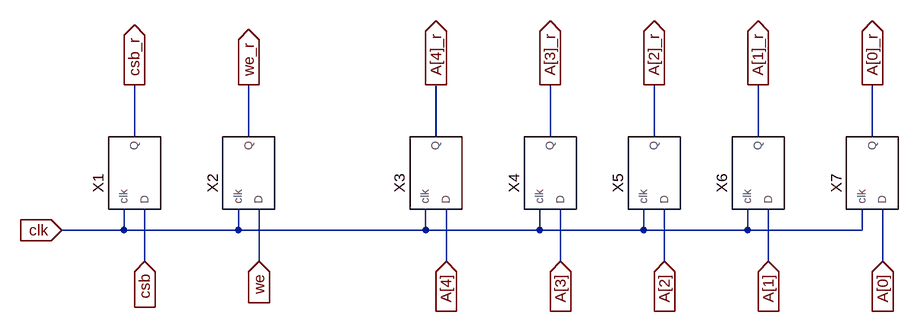
[diagram p0: schematic control_dffs.asc]
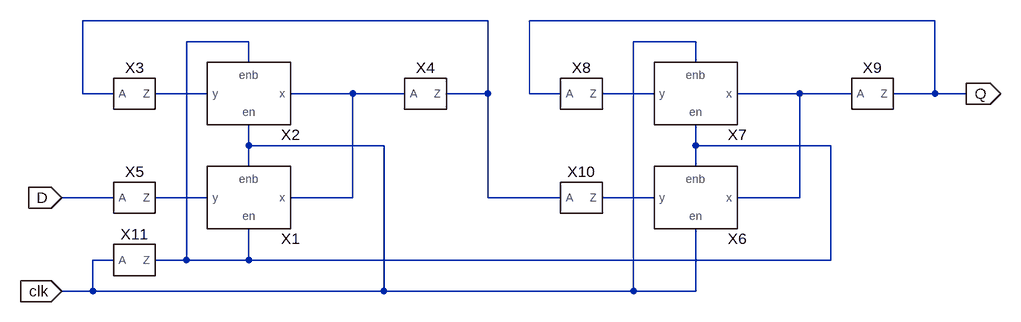
[diagram p1: sub-circuit dff.asc]
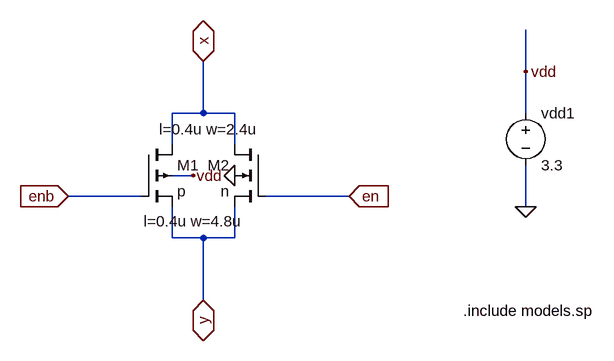
[diagram p2: sub-circuit tri_gate.asc]
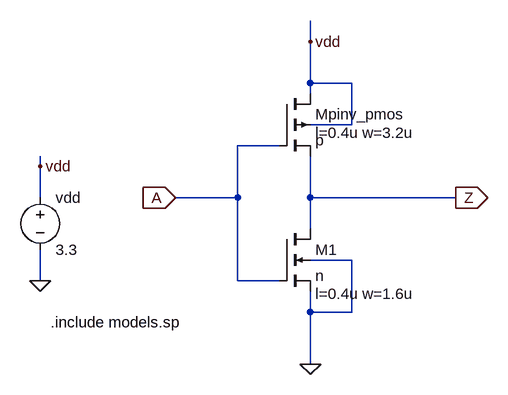
[diagram p3: sub-circuit inv.asc]
control_dffs.asc, the LTspice schematic file:
Version 4
SHEET 1 1192 680
WIRE -32 64 -32 -16
WIRE 144 64 144 -16
WIRE 432 64 432 -16
WIRE 608 64 608 -16
WIRE 768 64 768 -16
WIRE 928 64 928 -16
WIRE 1104 64 1104 -16
WIRE -48 208 -48 176
WIRE -48 208 -144 208
WIRE 128 208 128 176
WIRE 128 208 -48 208
WIRE 416 208 416 176
WIRE 416 208 128 208
WIRE 592 208 592 176
WIRE 592 208 416 208
WIRE 752 208 752 176
WIRE 752 208 592 208
WIRE 912 208 912 176
WIRE 912 208 752 208
WIRE 1088 208 1088 176
WIRE 1088 208 912 208
WIRE -16 256 -16 176
WIRE 160 256 160 176
WIRE 448 256 448 176
WIRE 624 256 624 176
WIRE 784 256 784 176
WIRE 944 256 944 176
WIRE 1120 256 1120 176
FLAG 448 256 A[4]
IOPIN 448 256 In
FLAG 624 256 A[3]
IOPIN 624 256 In
FLAG 784 256 A[2]
IOPIN 784 256 In
FLAG 944 256 A[1]
IOPIN 944 256 In
FLAG 1120 256 A[0]
IOPIN 1120 256 In
FLAG -16 256 csb
IOPIN -16 256 In
FLAG 160 256 we
IOPIN 160 256 In
FLAG -144 208 clk
IOPIN -144 208 In
FLAG -32 -16 csb_r
IOPIN -32 -16 Out
FLAG 144 -16 we_r
IOPIN 144 -16 Out
FLAG 432 -16 A[4]_r
IOPIN 432 -16 Out
FLAG 608 -16 A[3]_r
IOPIN 608 -16 Out
FLAG 768 -16 A[2]_r
IOPIN 768 -16 Out
FLAG 928 -16 A[1]_r
IOPIN 928 -16 Out
FLAG 1104 -16 A[0]_r
IOPIN 1104 -16 Out
SYMBOL dff -16 144 R270
SYMATTR InstName X1
SYMBOL dff 160 144 R270
SYMATTR InstName X2
SYMBOL dff 448 144 R270
SYMATTR InstName X3
SYMBOL dff 624 144 R270
SYMATTR InstName X4
SYMBOL dff 784 144 R270
SYMATTR InstName X5
SYMBOL dff 944 144 R270
SYMATTR InstName X6
SYMBOL dff 1120 144 R270
SYMATTR InstName X7

dff.asc, the sub-circuit schematic file:
Version 4
SHEET 1 1748 1736
WIRE 16 -160 -608 -160
WIRE 704 -160 80 -160
WIRE -352 -128 -448 -128
WIRE 336 -128 240 -128
WIRE -352 -96 -352 -128
WIRE 336 -96 336 -128
WIRE -608 -48 -608 -160
WIRE -560 -48 -608 -48
WIRE -416 -48 -496 -48
WIRE -192 -48 -288 -48
WIRE -112 -48 -192 -48
WIRE 16 -48 16 -160
WIRE 16 -48 -48 -48
WIRE 80 -48 80 -160
WIRE 128 -48 80 -48
WIRE 272 -48 192 -48
WIRE 496 -48 400 -48
WIRE 576 -48 496 -48
WIRE 704 -48 704 -160
WIRE 704 -48 640 -48
WIRE 752 -48 704 -48
WIRE -352 32 -352 0
WIRE -144 32 -352 32
WIRE 336 32 336 0
WIRE 544 32 336 32
WIRE -352 64 -352 32
WIRE 336 64 336 32
WIRE -560 112 -640 112
WIRE -416 112 -496 112
WIRE -192 112 -192 -48
WIRE -192 112 -288 112
WIRE 16 112 16 -48
WIRE 128 112 16 112
WIRE 272 112 192 112
WIRE 496 112 496 -48
WIRE 496 112 400 112
WIRE -560 208 -592 208
WIRE -448 208 -448 -128
WIRE -448 208 -496 208
WIRE -352 208 -352 160
WIRE -352 208 -448 208
WIRE 544 208 544 32
WIRE 544 208 -352 208
WIRE -592 256 -592 208
WIRE -592 256 -640 256
WIRE -144 256 -144 32
WIRE -144 256 -592 256
WIRE 240 256 240 -128
WIRE 240 256 -144 256
WIRE 336 256 336 160
WIRE 336 256 240 256
FLAG -640 256 clk
IOPIN -640 256 In
FLAG -640 112 D
IOPIN -640 112 In
FLAG 752 -48 Q
IOPIN 752 -48 Out
SYMBOL tri_gate -352 112 R180
SYMATTR InstName X1
SYMBOL tri_gate -352 -48 R180
SYMATTR InstName X2
SYMBOL inv -528 -48 R0
SYMATTR InstName X3
SYMBOL inv -80 -48 R0
SYMATTR InstName X4
SYMBOL inv -528 112 R0
SYMATTR InstName X5
SYMBOL tri_gate 336 112 R180
SYMATTR InstName X6
SYMBOL tri_gate 336 -48 R180
SYMATTR InstName X7
SYMBOL inv 160 -48 R0
SYMATTR InstName X8
SYMBOL inv 608 -48 R0
SYMATTR InstName X9
SYMBOL inv 160 112 R0
SYMATTR InstName X10
SYMBOL inv -528 208 R0
SYMATTR InstName X11

tri_gate.asc, the sub-circuit schematic file:
Version 4
SHEET 1 880 680
WIRE 576 -16 576 -80
WIRE 80 48 80 -32
WIRE 80 48 32 48
WIRE 128 48 80 48
WIRE 576 48 576 -16
WIRE 32 96 32 48
WIRE 128 96 128 48
WIRE 64 144 32 144
WIRE -16 176 -128 176
WIRE 304 176 176 176
WIRE 576 192 576 128
WIRE 32 240 32 192
WIRE 80 240 32 240
WIRE 128 240 128 192
WIRE 128 240 80 240
WIRE 80 336 80 240
FLAG 128 144 0
FLAG 64 144 vdd
FLAG 576 192 0
FLAG 576 -16 vdd
FLAG 80 336 y
IOPIN 80 336 BiDir
FLAG 80 -32 x
IOPIN 80 -32 BiDir
FLAG 304 176 en
IOPIN 304 176 In
FLAG -128 176 enb
IOPIN -128 176 In
SYMBOL pmos4 -16 96 R0
WINDOW 123 4 118 Left 2
SYMATTR Value2 l=0.4u w=4.8u
SYMATTR InstName M1
SYMATTR Value p
SYMBOL nmos4 176 96 M0
WINDOW 123 12 -23 Left 2
SYMATTR Value2 l=0.4u w=2.4u
SYMATTR InstName M2
SYMATTR Value n
SYMBOL voltage 576 32 R0
WINDOW 123 0 0 Left 0
WINDOW 39 0 0 Left 0
SYMATTR InstName vdd1
SYMATTR Value 3.3
TEXT 480 352 Left 2 !.include models.sp

inv.asc, the sub-circuit schematic file:
Version 4
SHEET 1 880 680
WIRE 112 -128 112 -160
WIRE 112 -64 112 -128
WIRE 176 -64 112 -64
WIRE 112 -48 112 -64
WIRE 176 0 176 -64
WIRE 176 0 112 0
WIRE 64 32 0 32
WIRE -304 64 -304 48
WIRE -304 112 -304 64
WIRE 0 112 0 32
WIRE 0 112 -96 112
WIRE 112 112 112 48
WIRE 336 112 112 112
WIRE 112 160 112 112
WIRE 176 208 112 208
WIRE -304 240 -304 192
WIRE 0 240 0 112
WIRE 64 240 0 240
WIRE 112 288 112 256
WIRE 176 288 176 208
WIRE 176 288 112 288
WIRE 112 368 112 288
FLAG -96 112 A
IOPIN -96 112 In
FLAG 336 112 Z
IOPIN 336 112 Out
FLAG 112 368 0
FLAG -304 240 0
FLAG 112 -128 vdd
FLAG -304 64 vdd
SYMBOL nmos4 64 160 R0
WINDOW 123 56 100 Left 2
SYMATTR Value2 l=0.4u w=1.6u
SYMATTR InstName M1
SYMATTR Value n
SYMBOL pmos4 64 -48 R0
WINDOW 123 56 60 Left 2
SYMATTR Value2 l=0.4u w=3.2u
SYMATTR InstName Mpinv_pmos
SYMATTR Value p
SYMBOL voltage -304 96 R0
SYMATTR InstName vdd
SYMATTR Value 3.3
TEXT -288 304 Left 2 !.include models.sp

The netlist it stands for:
* control_dffs.asc
XX1 clk csb csb_r dff
XX2 clk we we_r dff
XX3 clk A[4] A[4]_r dff
XX4 clk A[3] A[3]_r dff
XX5 clk A[2] A[2]_r dff
XX6 clk A[1] A[1]_r dff
XX7 clk A[0] A[0]_r dff

* block symbol definitions
.subckt dff clk D Q
XX1 N002 clk N004 N007 tri_gate
XX2 clk N002 N004 N003 tri_gate
XX3 N001 N003 inv
XX4 N004 N001 inv
XX5 D N007 inv
XX6 clk N002 N006 N008 tri_gate
XX7 N002 clk N006 N005 tri_gate
XX8 Q N005 inv
XX9 N006 Q inv
XX10 N001 N008 inv
XX11 clk N002 inv
.ends dff

.subckt tri_gate en enb x y
M1 x enb y vdd p l=0.4u w=4.8u
M2 x en y 0 n l=0.4u w=2.4u
vdd1 vdd 0 3.3
.include models.sp
.ends tri_gate

.subckt inv A Z
M1 Z A 0 0 n l=0.4u w=1.6u
Mpinv_pmos vdd A Z vdd p l=0.4u w=3.2u
vdd vdd 0 3.3
.include models.sp
.ends inv

.model NMOS NMOS
.model PMOS PMOS
.lib standard.mos
.backanno
.end